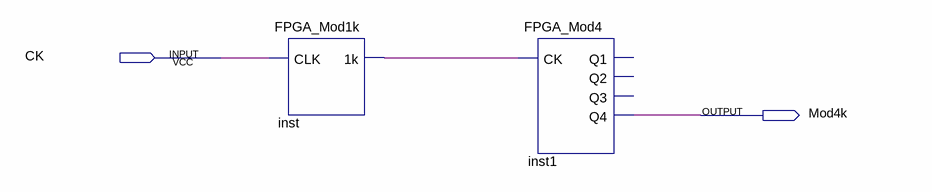
[diagram p0: schematic sheet]
// Quartus schematic FPGA_Mod4k.bdf as structural Verilog: 2 symbols, 2 pins
module FPGA_Mod4k (
  input  CK,
  output Mod4k
);

  wire inst_1k;

  FPGA_Mod1k inst (.CLK(CK), .\1k (inst_1k));
  FPGA_Mod4 inst1 (.CK(inst_1k), .Q4(Mod4k));  // open: Q1, Q2, Q3
endmodule
